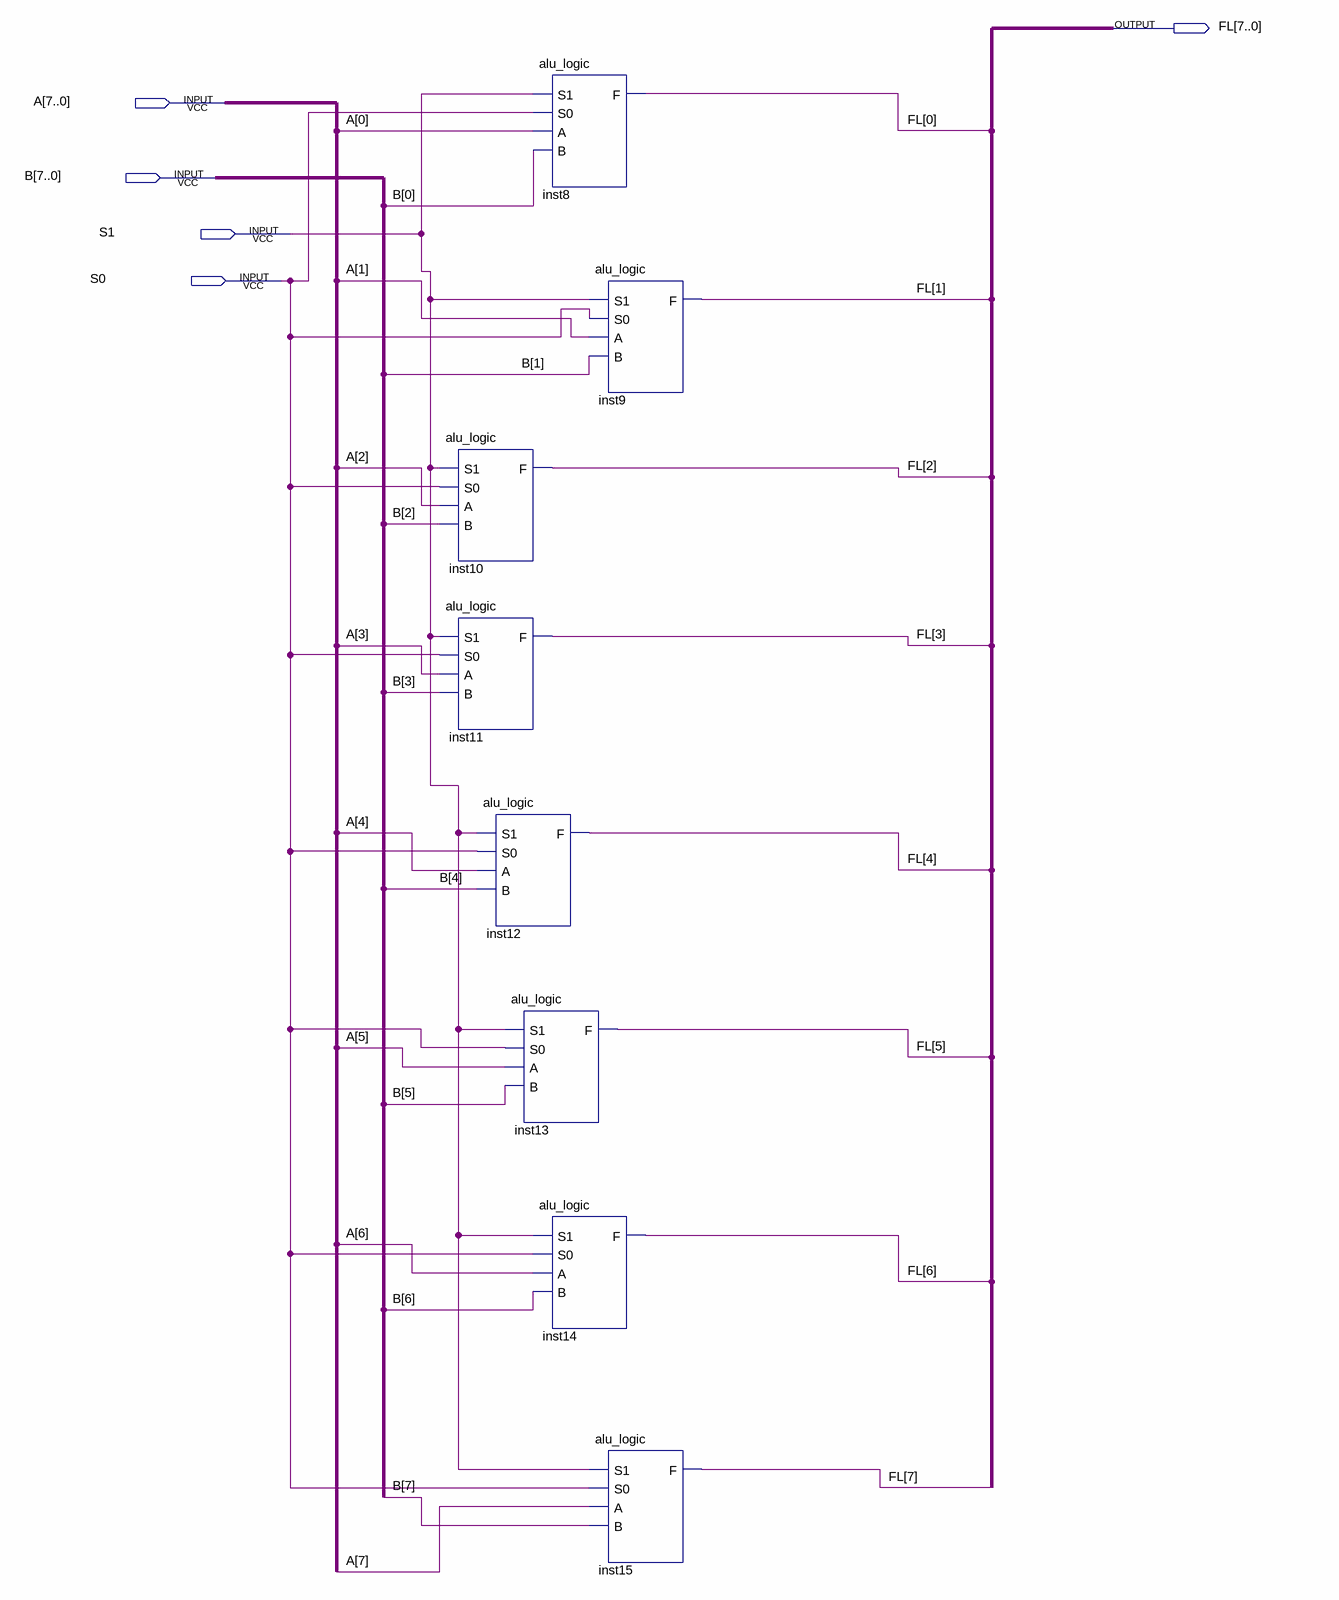
[diagram p0: schematic sheet]
// Quartus schematic logic_8bit.bdf as structural Verilog: 8 symbols, 5 pins
module logic_8bit (
  input  [7:0] A,
  input  [7:0] B,
  input  S1,
  input  S0,
  output [7:0] FL
);

  alu_logic inst10 (.S1(S1), .S0(S0), .A(A[2]), .B(B[2]), .F(FL[2]));
  alu_logic inst11 (.S1(S1), .S0(S0), .A(A[3]), .B(B[3]), .F(FL[3]));
  alu_logic inst12 (.S1(S1), .S0(S0), .A(A[4]), .B(B[4]), .F(FL[4]));
  alu_logic inst8 (.S1(S1), .S0(S0), .A(A[0]), .B(B[0]), .F(FL[0]));
  alu_logic inst13 (.S1(S1), .S0(S0), .A(A[5]), .B(B[5]), .F(FL[5]));
  alu_logic inst14 (.S1(S1), .S0(S0), .A(A[6]), .B(B[6]), .F(FL[6]));
  alu_logic inst9 (.S1(S1), .S0(S0), .A(A[1]), .B(B[1]), .F(FL[1]));
  alu_logic inst15 (.S1(S1), .S0(S0), .A(A[7]), .B(B[7]), .F(FL[7]));
endmodule
